# Altium project 24LC16-ISN.PrjPcb
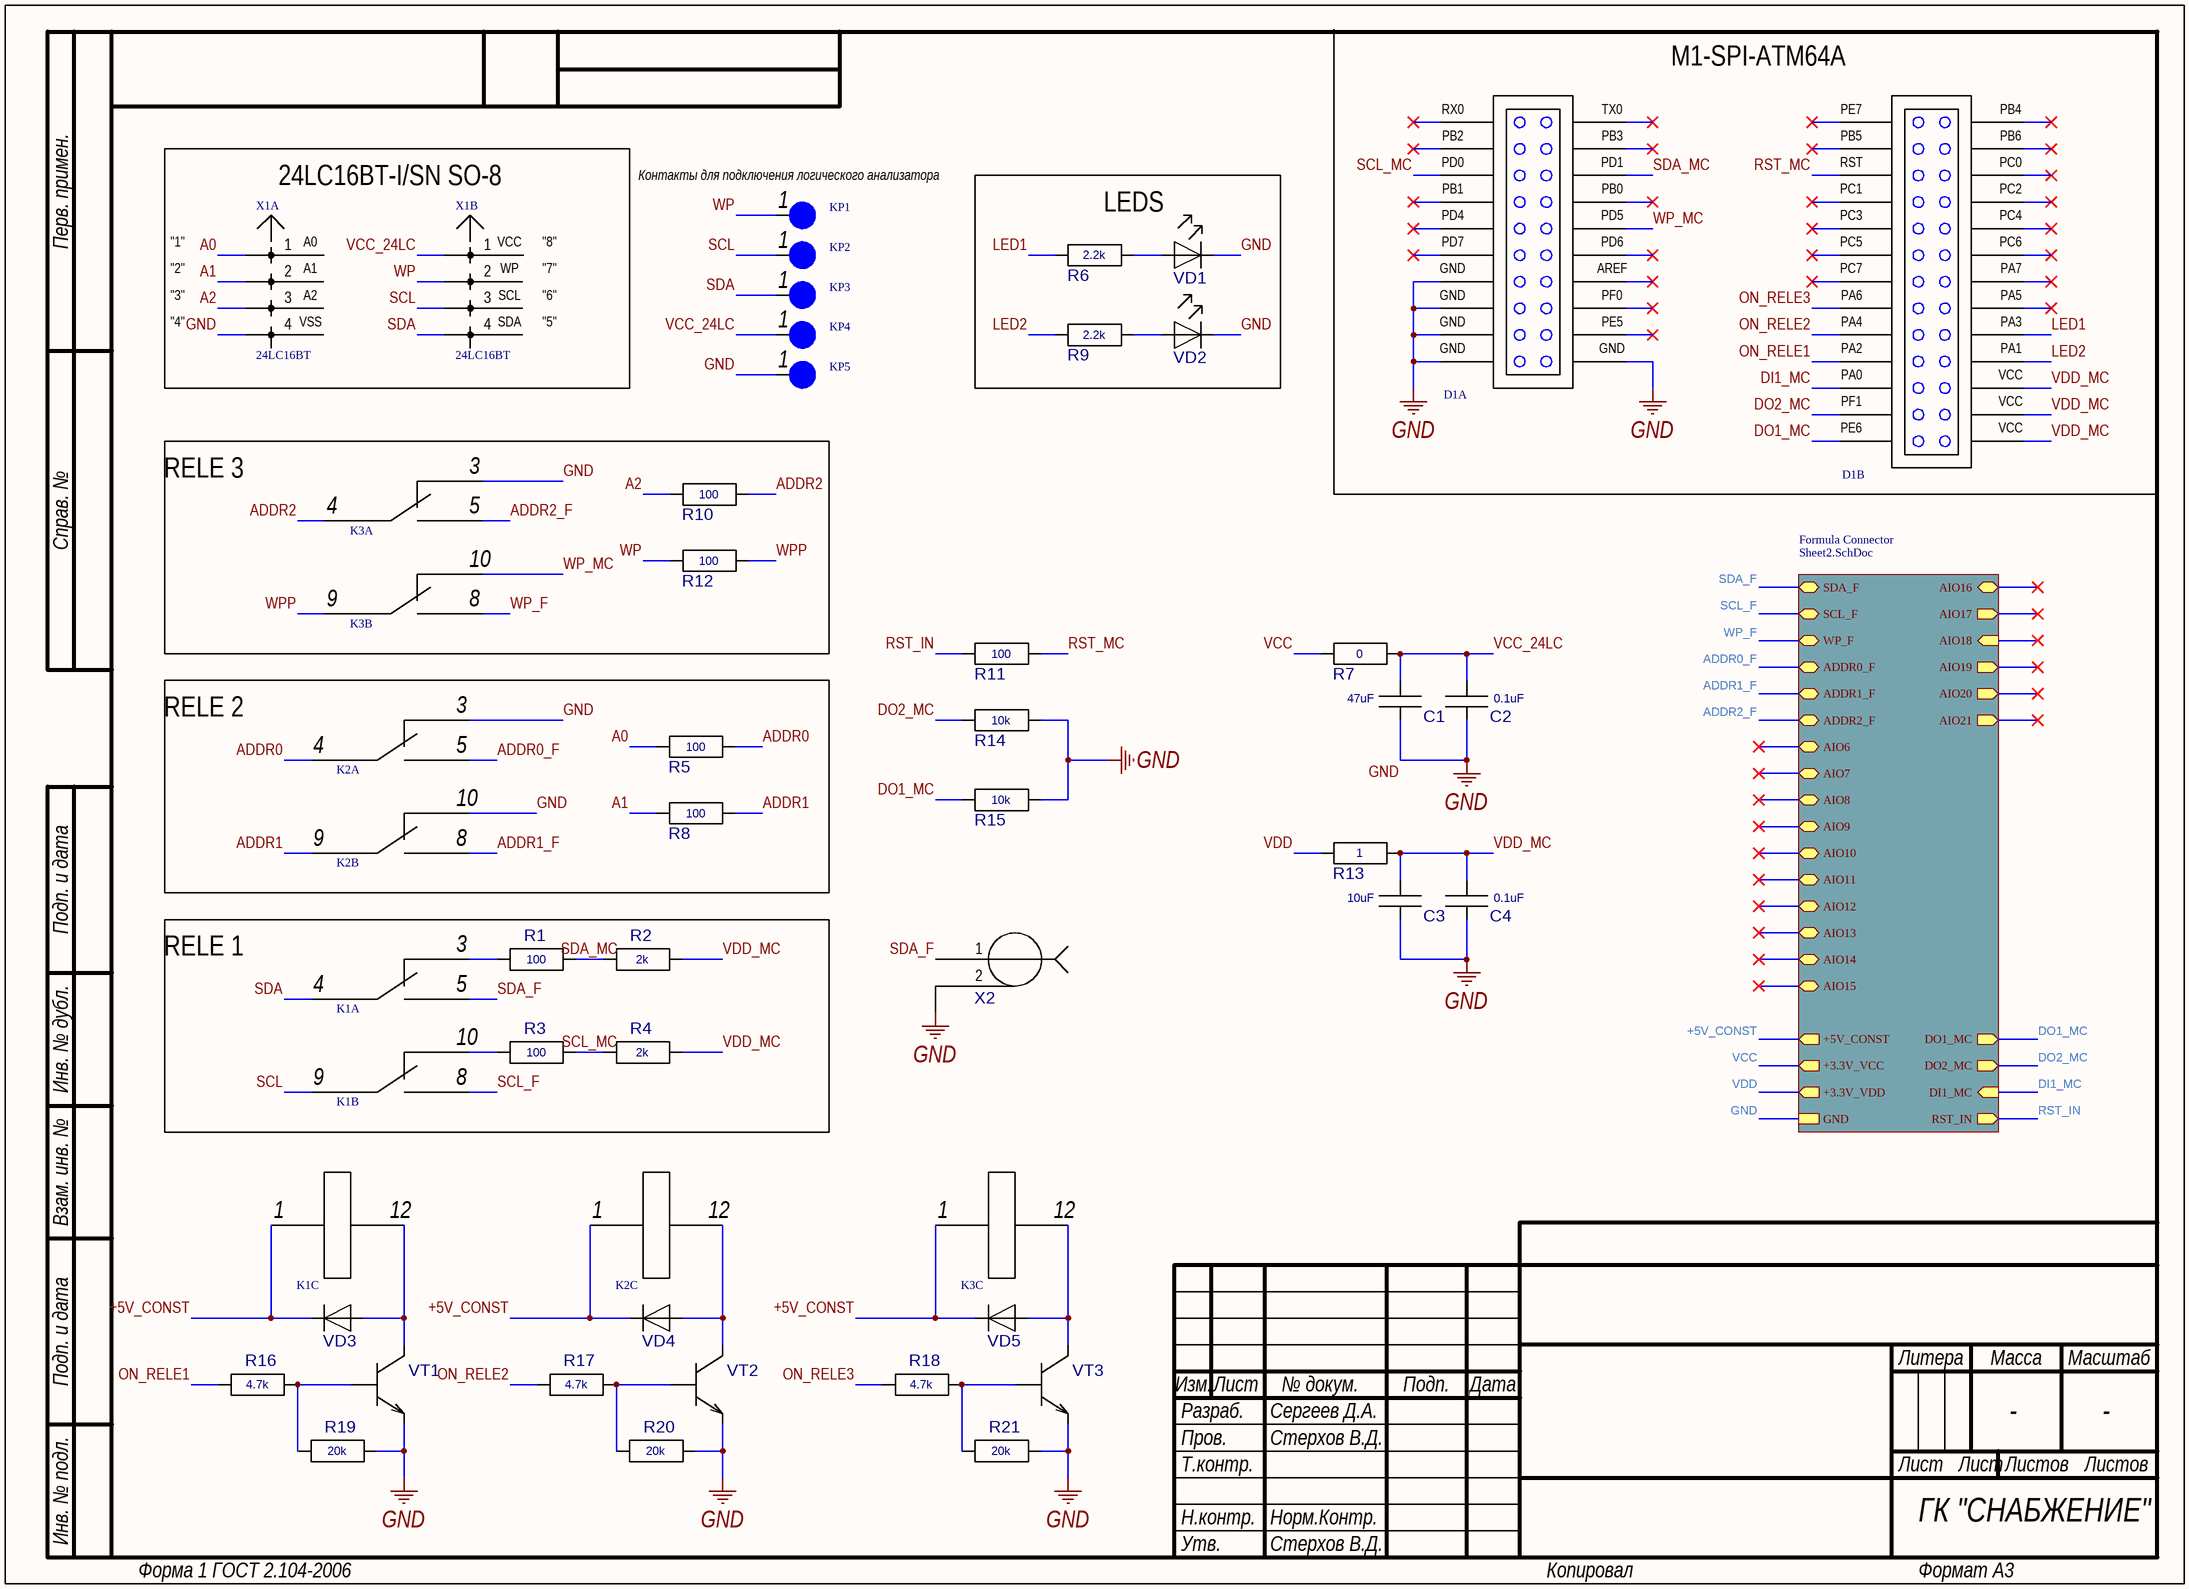
[diagram p0: Sheet1.SchDoc]
2 sheets, 47 parts. Net scope: strictly hierarchical (ports join the sheet entries above them; power ports are local).
Board file: PCB1.PcbDoc
Sheets:
  Sheet1.SchDoc
    Formula Connector = Sheet2.SchDoc

## Sheet Sheet1.SchDoc: =GlobalProjectName
size 410 x 297 mm; ENG_APP_DATE: --/--/--; DSN_APP_DATE: --/--/--; CHK_APP_DATE: --/--/--; ApprovedBy: Стерхов В.Д.; CheckedBy: Стерхов В.Д.; Author: Сергеев Д.А.; CompanyName: ГК "СНАБЖЕНИЕ"; Organization: ГК "СНАБЖЕНИЕ"; SheetNumber: Лист; SheetTotal: Листов; PageSetup: Record=PageOptions|CenterHorizontal=True|CenterVertical=True|PrintScale=1.00|XCorrection=1.00|YCorrection=1.00|PrintKind=1|BorderSize=5000000|LeftOffset=0|BottomOffset=0|Orientation=2|PaperLength=1000|PaperWidth=1000|Scale=100|PaperSource=15|PrintQuality=1200|MediaType=1|DitherType=10|PaperKind=A3|PrintScaleMode=1; Weight: -; ScaleFactor: -; NormInspection: Норм.Контр.

### Parts
C1  47uF  [0805]
C2  0.1uF  [0805]
C3  10uF  [0805]
C4  0.1uF  [0805]
D1  M1-SPI-ATM64  [M1-SPI-ATM64]  (value not drawn)  (parts A,B of 2)
K1  V23079A1001B301 TE  [V23079A1001B301]  (value not drawn)  (parts A,B,C of 3)
K2  V23079A1001B301 TE  [V23079A1001B301]  (value not drawn)  (parts A,B,C of 3)
K3  V23079A1001B301 TE  [V23079A1001B301]  (value not drawn)  (parts A,B,C of 3)
KP1  Contact  [Contact]  (value not drawn)
KP2  Contact  [Contact]  (value not drawn)
KP3  Contact  [Contact]  (value not drawn)
KP4  Contact  [Contact]  (value not drawn)
KP5  Contact  [Contact]  (value not drawn)
R1  100  [0805]
R2  2k  [0805]
R3  100  [0805]
R4  2k  [0805]
R5  100  [0805]
R6  2.2k  [0805]
R7  0  [0805]
R8  100  [0805]
R9  2.2k  [0805]
R10  100  [0805]
R11  100  [0805]
R12  100  [0805]
R13  1  [0805]
R14  10k  [0805]
R15  10k  [0805]
R16  4.7k  [0805]
R17  4.7k  [0805]
R18  4.7k  [0805]
R19  20k  [0805]
R20  20k  [0805]
R21  20k  [0805]
VD1  LED(0805)  [0805(LED)]  (value not drawn)
VD2  LED(0805)  [0805(LED)]  (value not drawn)
VD3  LL4148 NXP  [SOD80C]  (value not drawn)
VD4  LL4148 NXP  [SOD80C]  (value not drawn)
VD5  LL4148 NXP  [SOD80C]  (value not drawn)
VT1  MMBT5551L  [SOT-23]  (value not drawn)
VT2  MMBT5551L  [SOT-23]  (value not drawn)
VT3  MMBT5551L  [SOT-23]  (value not drawn)
X1  24LC16BT  [SSOP to DIP8]  (parts A,B of 2)
X2  BNC-7038  [BNC-7038]  (value not drawn)

### Blocks framed on the sheet
24LC16BT-I/SN SO-8: X1
LEDS: R6 R9 VD1 VD2
RELE 3: K3 R10 R12
RELE 2: K2 R5 R8
RELE 1: K1 R1-R4

### Sub-sheets
Formula Connector = Sheet2.SchDoc: SCL_F (bidir), WP_F (bidir), ADDR0_F (bidir), ADDR1_F (bidir), ADDR2_F (bidir), AIO6 (bidir), AIO7 (bidir), AIO8 (bidir), AIO9 (bidir), AIO10 (bidir), AIO11 (bidir), AIO12 (bidir), AIO13 (bidir), AIO14 (bidir), AIO15 (bidir), AIO16 (bidir), AIO17 (out), AIO18 (in), AIO19 (out), AIO20 (out), AIO21 (out), +5V_CONST (out), +3.3V_VCC (out), +3.3V_VDD (out), GND, DO1_MC (out), DO2_MC (out), DI1_MC (in), RST_IN (out), SDA_F (bidir)

### Nets
GND: C1.2 C2.2 C3.2 C4.2 D1.13 D1.15 D1.17 D1.19 D1.20 K2.3 K2.10 K3.3 KP5.1 R14.2 R15.2 R19.2 R20.2 R21.2 VD1.2(K) VD2.2(K) VT1.2(E) VT2.2(E) VT3.2(E) X1.4 X2.2 ; sheet Formula Connector/GND
+5V_CONST: K1.1 K2.1 K3.1 VD3.2(K) VD4.2(K) VD5.2(K) ; sheet Formula Connector/+5V_CONST
A0: R5.1 X1.1
A1: R8.1 X1.2
A2: R10.1 X1.3
ADDR0: K2.4 R5.2
ADDR0_F: K2.5 ; sheet Formula Connector/ADDR0_F
ADDR1: K2.9 R8.2
ADDR1_F: K2.8 ; sheet Formula Connector/ADDR1_F
ADDR2: K3.4 R10.2
ADDR2_F: K3.5 ; sheet Formula Connector/ADDR2_F
DI1_MC: D1.41 ; sheet Formula Connector/DI1_MC
DO1_MC: D1.45 R15.1 ; sheet Formula Connector/DO1_MC
DO2_MC: D1.43 R14.1 ; sheet Formula Connector/DO2_MC
LED1: D1.38 R6.1
LED2: D1.40 R9.1
ON_RELE1: D1.39 R16.1
ON_RELE2: D1.37 R17.1
ON_RELE3: D1.35 R18.1
RST_IN: R11.1 ; sheet Formula Connector/RST_IN
RST_MC: D1.25 R11.2
SCL: K1.9 KP2.1 X1.6
SCL_F: K1.8 ; sheet Formula Connector/SCL_F
SCL_MC: D1.5 R3.2 R4.1
SDA: K1.4 KP3.1 X1.5
SDA_F: K1.5 X2.1 ; sheet Formula Connector/SDA_F
SDA_MC: D1.6 R1.2 R2.1
VCC: R7.1 ; sheet Formula Connector/+3.3V_VCC  [project net +3.3V_VCC]
VCC_24LC: C1.1 C2.1 KP4.1 R7.2 X1.8
VDD: R13.1 ; sheet Formula Connector/+3.3V_VDD  [project net +3.3V_VDD]
VDD_MC: C3.1 C4.1 D1.42 D1.44 D1.46 R2.2 R4.2 R13.2
WP: KP1.1 R12.1 X1.7
WP_F: K3.8 ; sheet Formula Connector/WP_F
WP_MC: D1.10 K3.10
WPP: K3.9 R12.2
NetK1_3: K1.3 R1.1
NetK1_10: K1.10 R3.1
NetK1_12: K1.12 VD3.1(A) VT1.3(K)
NetK2_12: K2.12 VD4.1(A) VT2.3(K)
NetK3_12: K3.12 VD5.1(A) VT3.3(K)
NetR6_2: R6.2 VD1.1(A)
NetR9_2: R9.2 VD2.1(A)
NetR16_2: R16.2 R19.1 VT1.1(B)
NetR17_2: R17.2 R20.1 VT2.1(B)
NetR18_2: R18.2 R21.1 VT3.1(B)

Not connected (* = marked no-connect by the designer): D1 1* 2* 3* 4* 7* 8* 9* 11* 12* 14* 16* 18* 21* 22* 23* 24* 26* 27* 28* 29* 30* 31* 32* 33* 34* 36*

### Notes on the sheet
- M1-SPI-ATM64A
- (near KP1) Контакты для подключения логического анализатора
- "1"
- "8"
- "2"
- "3"
- "4"
- "7"
- "6"
- "5"
- Перв. примен.
- Справ. №
- Подп. и дата
- Инв. № дубл.
- Взам. инв. №
- Разраб.
- Изм.
- Лист
- № докум.
- Подп.
- Дата
- Литера
- Масса
- Масштаб
- Пров.
- Т.контр.
- Листов
- Инв. № подл.
- Н.контр.
- Утв.
- Форма 1 ГОСТ 2.104-2006
- Копировал
- Формат А3

### Library data of the parts
C1-C4 = C0805: ComponentHeigt: 1.3; Firme: AVX; Leadform: SMD; KIND: Конденсатор; ClassName: *; Component Link: *; ComponentWeigt: *; Packaging: 0805; NN: *; Value: *
R1-R21 = R0805 Yageo: ComponentHeigt: 0.6; Firme: Yageo; Leadform: SMD; Kind: Резистор; ClassName: *; ComponentWeigt: *; Component Link: *; Packaging: 0805; NN: *; Value: *
VD1 VD2 = LED(0805): ComponentHeigt: 0.75; Leadform: в отверстия; Firme: Kingbright; NN: 24003000; KIND: Светодиод L-1154GD Kingbright; Component Link: *; ClassName: *
VD3-VD5 = LL4148 NXP: ComponentHeigt: 1.6; Leadform: SMD; NN: 24009301; KIND: Диод LL4148 NXP; Component Link: http://www.nxp.com; Packaging: SOD-80C; ClassName: *; Firme: NXP
VT1-VT3 = MMBT5551L: ComponentHeigt: 1.1; Firme: ONS; Leadform: SMD; NN: 24007468; KIND: Транзистор MMBT5551L*G ONS; ClassName: *; ComponentWeigt: *; Packaging: SOT-23
X2 = BNC-7038: ComponentHeigt: 5.5; Name: Вилка; Specification: Вилка PLD2-2 *; Typ: PLD2-2; ClassName: *; Component Link: *; ComponentWeigt: *; Firme: *; Leadform: *; NN: *; KIND: *

## Sheet Sheet2.SchDoc: =GlobalProjectName
size 410 x 297 mm; ENG_APP_DATE: --/--/--; DSN_APP_DATE: --/--/--; CHK_APP_DATE: --/--/--; ApprovedBy: Утвердил; CheckedBy: Проверил; Author: Разработал; SheetNumber: Лист; SheetTotal: Листов; PageSetup: Record=PageOptions|CenterHorizontal=True|CenterVertical=True|PrintScale=1.00|XCorrection=1.00|YCorrection=1.00|PrintKind=1|BorderSize=5000000|LeftOffset=0|BottomOffset=0|Orientation=2|PaperLength=1000|PaperWidth=1000|Scale=100|PaperSource=15|PrintQuality=1200|MediaType=1|DitherType=10|PaperKind=A3|PrintScaleMode=1; Weight: -; ScaleFactor: -; NormInspection: Норм.Контр.
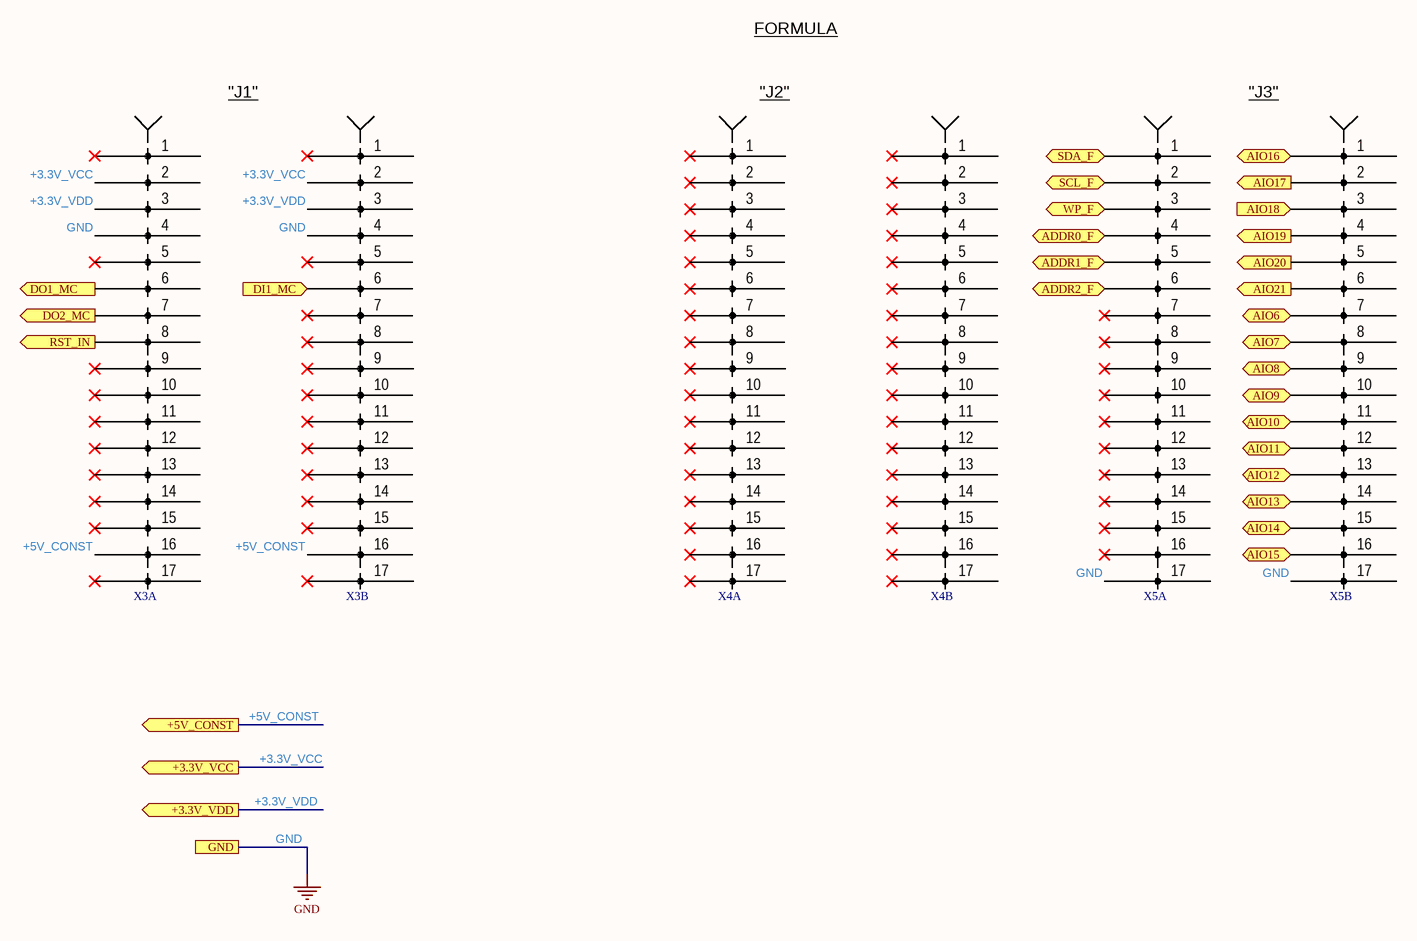
[diagram p1: Sheet2.SchDoc]

### Parts
X3  PLS34-2.54  [PLS34-2.54]  (value not drawn)  (parts A,B of 2)
X4  PLS34-2.54  [PLS34-2.54]  (value not drawn)  (parts A,B of 2)
X5  PLS34-2.54  [PLS34-2.54]  (value not drawn)  (parts A,B of 2)

### Ports
+3.3V_VCC (out), +3.3V_VDD (out), +5V_CONST (out), ADDR0_F (bidir), ADDR1_F (bidir), ADDR2_F (bidir), AIO6 (bidir), AIO7 (bidir), AIO8 (bidir), AIO9 (bidir), AIO10 (bidir), AIO11 (bidir), AIO12 (bidir), AIO13 (bidir), AIO14 (bidir), AIO15 (bidir), AIO16 (bidir), AIO17 (out), AIO18 (in), AIO19 (out), AIO20 (out), AIO21 (out), DI1_MC (in), DO1_MC (out), DO2_MC (out), GND, RST_IN (out), SCL_F (bidir), SDA_F (bidir), WP_F (bidir)

### Nets
GND: X3.4 X3.21 X5.17 X5.34 ; port GND
+3.3V_VCC: X3.2 X3.19 ; port +3.3V_VCC
+3.3V_VDD: X3.3 X3.20 ; port +3.3V_VDD
+5V_CONST: X3.16 X3.33 ; port +5V_CONST
ADDR0_F: X5.4 ; port ADDR0_F
ADDR1_F: X5.5 ; port ADDR1_F
ADDR2_F: X5.6 ; port ADDR2_F
DI1_MC: X3.23 ; port DI1_MC
DO1_MC: X3.6 ; port DO1_MC
DO2_MC: X3.7 ; port DO2_MC
RST_IN: X3.8 ; port RST_IN
SCL_F: X5.2 ; port SCL_F
SDA_F: X5.1 ; port SDA_F
WP_F: X5.3 ; port WP_F
NetX5_18: X5.18 ; port AIO16
NetX5_19: X5.19 ; port AIO17
NetX5_20: X5.20 ; port AIO18
NetX5_21: X5.21 ; port AIO19
NetX5_22: X5.22 ; port AIO20
NetX5_23: X5.23 ; port AIO21
NetX5_24: X5.24 ; port AIO6
NetX5_25: X5.25 ; port AIO7
NetX5_26: X5.26 ; port AIO8
NetX5_27: X5.27 ; port AIO9
NetX5_28: X5.28 ; port AIO10
NetX5_29: X5.29 ; port AIO11
NetX5_30: X5.30 ; port AIO12
NetX5_31: X5.31 ; port AIO13
NetX5_32: X5.32 ; port AIO14
NetX5_33: X5.33 ; port AIO15

Not connected (* = marked no-connect by the designer): X3 1* 5* 9* 10* 11* 12* 13* 14* 15* 17* 18* 22* 24* 25* 26* 27* 28* 29* 30* 31* 32* 34*; X4 1* 2* 3* 4* 5* 6* 7* 8* 9* 10* 11* 12* 13* 14* 15* 16* 17* 18* 19* 20* 21* 22* 23* 24* 25* 26* 27* 28* 29* 30* 31* 32* 33* 34*; X5 7* 8* 9* 10* 11* 12* 13* 14* 15* 16*

### Notes on the sheet
- FORMULA
- "J1"
- "J2"
- "J3"
- Перв. примен.
- Справ. №
- Подп. и дата
- Инв. № дубл.
- Взам. инв. №
- Разраб.
- Изм.
- Лист
- № докум.
- Подп.
- Дата
- Литера
- Масса
- Масштаб
- Пров.
- Т.контр.
- Листов
- Инв. № подл.
- Н.контр.
- Утв.
- Форма 1 ГОСТ 2.104-2006
- Копировал
- Формат А3

## Nets that join several sheets
GND: Sheet1 (25 pins), Sheet2 (X3.4 X3.21 X5.17 X5.34)
+3.3V_VCC: Sheet1 (R7.1), Sheet2 (X3.2 X3.19)
+3.3V_VDD: Sheet1 (R13.1), Sheet2 (X3.3 X3.20)
+5V_CONST: Sheet1 (6 pins), Sheet2 (X3.16 X3.33)
ADDR0_F: Sheet1 (K2.5), Sheet2 (X5.4)
ADDR1_F: Sheet1 (K2.8), Sheet2 (X5.5)
ADDR2_F: Sheet1 (K3.5), Sheet2 (X5.6)
DI1_MC: Sheet1 (D1.41), Sheet2 (X3.23)
DO1_MC: Sheet1 (D1.45 R15.1), Sheet2 (X3.6)
DO2_MC: Sheet1 (D1.43 R14.1), Sheet2 (X3.7)
RST_IN: Sheet1 (R11.1), Sheet2 (X3.8)
SCL_F: Sheet1 (K1.8), Sheet2 (X5.2)
SDA_F: Sheet1 (K1.5 X2.1), Sheet2 (X5.1)
WP_F: Sheet1 (K3.8), Sheet2 (X5.3)